# Altium project GIGA R1 WiFi.PrjPcb (part 1 of 2)
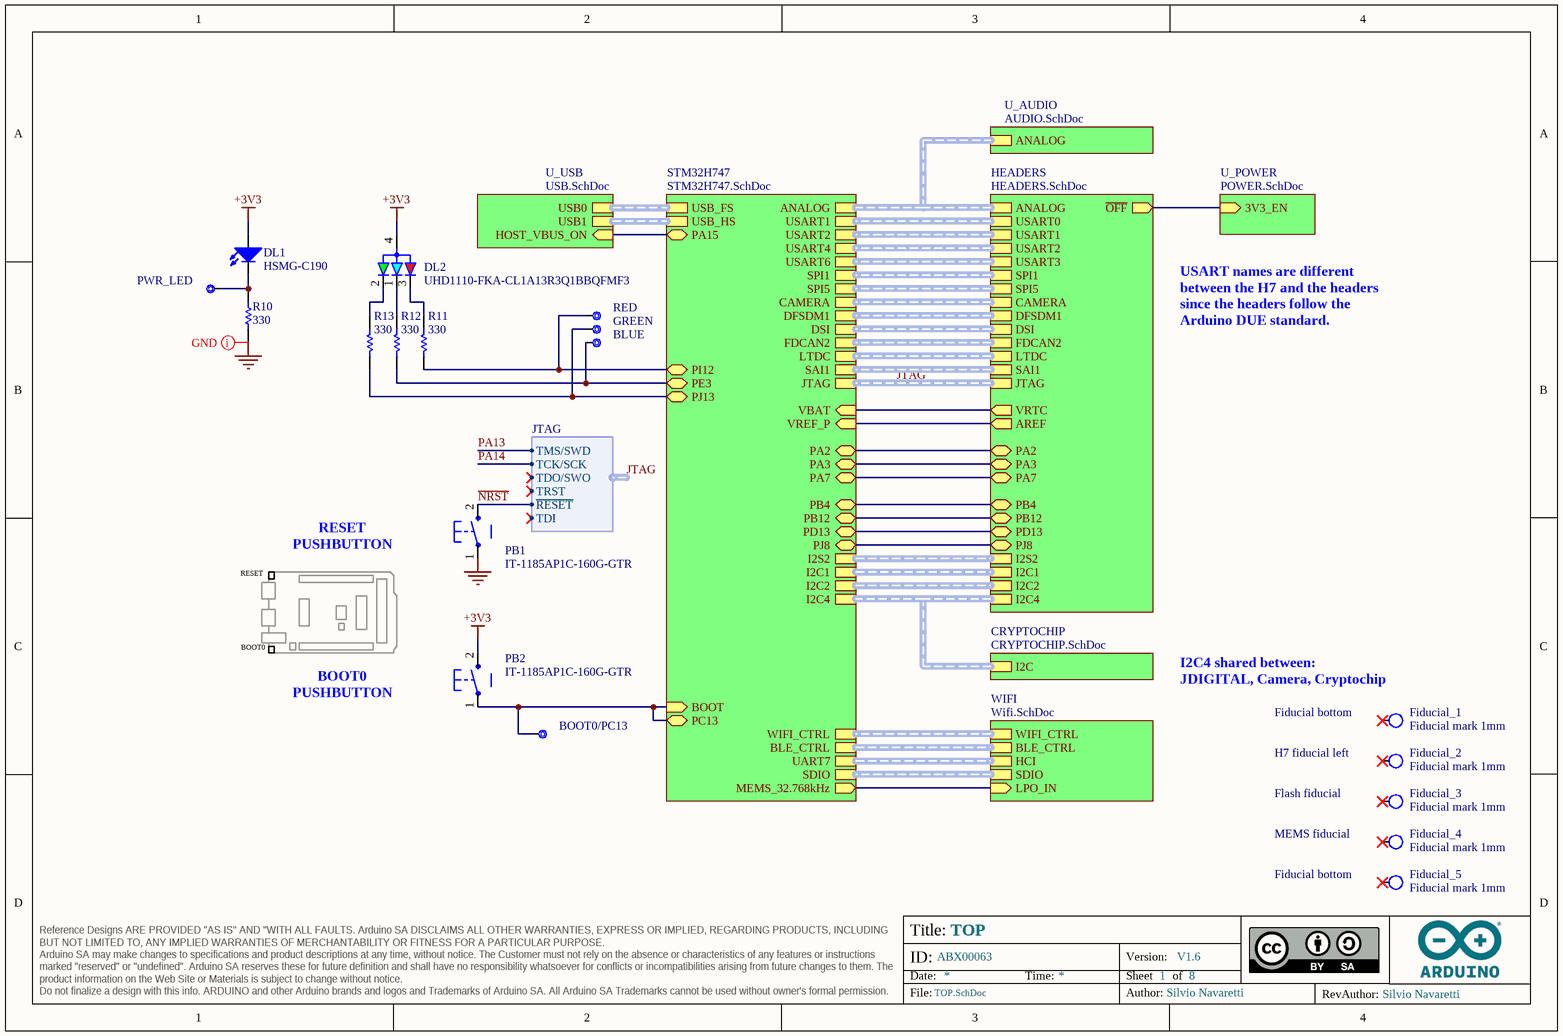
[diagram p0: TOP.SchDoc]
ADJUSTMENTS: _; BGA: X; BOARD_CODENAME: GIGA R1 WiFi; BOARD_INFO_AUTHOR: Silvio Navaretti; BOARD_INFO_AUTHOR_REV: Silvio Navaretti; DRILLS_BLIND: _; DRILLS_BURIED: _; DRILLS_COPPER_FILLING: _; DRILLS_FULL: X; DRILLS_LASER: _; DRILLS_PRESSFIT: _; DRILLS_RESIN_FILLING: _; DRILLS_SLOT: _; DRILLS_SOLDER_FILLING: X; EDGE_PLATING: _; ENIG: X; Er: _; FINISH_TBD: _; FLEX: _; FR4: X; FR4_HTG: _; HAL: _; HAL_LF: _; HOLE_TOP_BOTTOM: X; IPC1: _; IPC2: _; IPC3: _; IPCNA: _; MILLING: X; MIN_INSULATION_INNER: 0.127mm; MIN_INSULATION_OUTER: 0.127mm; MIN_TRACK_WIDTH_INNER: 0.127mm; MIN_TRACK_WIDTH_OUTER: 0.127mm; N_FIGURES: 6; NI/AU: _; NLAYERS: 6; PANEL_NO: _; PANEL_PROVIDED: X; PANEL_REQUESTED: _; PANEL_SIZE: 228mm x 179mm; PCB_SIZE: 101.6mm x 53.34mm; POLYMIDE: _; PRESSFIT: _; RIGID: X; RIGID/FLEX: _; SCORING: _; SILK_BOTTOM: X; SILK_COLOR: WHITE; SILK_TOP: X; SKU: ABX00063; SMD: X; SN/PB: _; SOLDERMASK_BOTTOM: X; SOLDERMASK_COLOR: BLUE; SOLDERMASK_PEELABLE_BOTTOM: _; SOLDERMASK_PEELABLE_COLOR: _; SOLDERMASK_PEELABLE_TOP: _; SOLDERMASK_TOP: X; TABS: _; TBD: _; THD: X; THICKNESS: 1.6mm; Version: V1.6
8 sheets, 228 parts. Net scope: hierarchical (ports join the sheet entries above them; power ports are global).
Board files: PCB.PcbDoc, PANEL.PcbDoc
Sheets:
  TOP.SchDoc
    U_AUDIO = AUDIO.SchDoc
    U_POWER = POWER.SchDoc
    U_USB = USB.SchDoc
    STM32H747 = STM32H747.SchDoc
    HEADERS = HEADERS.SchDoc
    WIFI = Wifi.SchDoc
    CRYPTOCHIP = CRYPTOCHIP.SchDoc

## Sheet TOP.SchDoc: TOP
size A4; Author: Silvio Navaretti; CompanyName: Arduino srl; DocumentNumber: ABX00063; Revision: V1.2; SheetNumber: 1; SheetTotal: 8; RevAuthor: Silvio Navaretti

### Parts
BLUE  CMP-018-0005-A.3  [TP-1.00MM]  (value not drawn)  (no BOM)
BOOT0/PC13  CMP-018-0005-A.3  [TP-1.00MM]  (value not drawn)  (no BOM)
DL1  HSMG-C190  [LEDC1608X80N-AK]
DL2  UHD1110-FKA-CL1A13R3Q1BBQFMF3  [UHD1110-FKA-CL1A13R3Q1BBQFMF3]
Fiducial_1  Fiducial mark 1mm  [Fiducial mark 1mm-Footprint-1]  (no BOM)
Fiducial_2  Fiducial mark 1mm  [Fiducial mark 1mm-Footprint-1]  (no BOM)
Fiducial_3  Fiducial mark 1mm  [Fiducial mark 1mm-Footprint-1]  (no BOM)
Fiducial_4  Fiducial mark 1mm  [Fiducial mark 1mm-Footprint-1]  (no BOM)
Fiducial_5  Fiducial mark 1mm  [Fiducial mark 1mm-Footprint-1]  (no BOM)
GREEN  CMP-018-0005-A.3  [TP-1.00MM]  (value not drawn)  (no BOM)
PB1  IT-1185AP1C-160G-GTR  [C&K_PTS820_NO_HOLES-1]
PB2  IT-1185AP1C-160G-GTR  [C&K_PTS820_NO_HOLES-1]
PWR_LED  CMP-018-0005-A.3  [TP-1.00MM]  (value not drawn)  (no BOM)
R10  value 330  [RES-0402]  (hidden comment: CRCW0402330RJNED)
R11  value 330  [RES-0402]  (hidden comment: CRCW0402330RJNED)
R12  value 330  [RES-0402]  (hidden comment: CRCW0402330RJNED)
R13  value 330  [RES-0402]  (hidden comment: CRCW0402330RJNED)
RED  CMP-018-0005-A.3  [TP-1.00MM]  (value not drawn)  (no BOM)

### Sub-sheets
CRYPTOCHIP = CRYPTOCHIP.SchDoc: I2C (harness I2C)
HEADERS = HEADERS.SchDoc: SPI5 (harness SPI), PB4 (bidir), I2C1 (harness I2C), LTDC (harness LTDC), SAI1 (harness SAI), I2C4 (harness I2C), USART0 (harness UART), USART3 (harness UART), USART2 (harness UART), USART1 (harness UART), I2C2 (harness I2C), PD13 (bidir), PA7 (bidir), PJ8 (bidir), PA2 (bidir), PA3 (bidir), ANALOG (harness ANALOG), FDCAN2 (harness FDCAN), I2S2 (harness I2S), DSI (harness DISPLAY), DFSDM1 (harness DFSDM), SPI1 (harness SPI), CAMERA (harness ARDUCAM), AREF (out), ~{OFF} (out), VRTC (out), JTAG (harness JTAG), PB12 (bidir)
STM32H747 = STM32H747.SchDoc: BOOT (in), DSI (harness DISPLAY), VREF_P (in), SDIO (harness SDC), USB_FS (harness USB), USB_HS (harness USB), PI12 (bidir), PE3 (bidir), PJ13 (bidir), UART7 (harness UART), PC13 (bidir), I2C1 (harness I2C), USART1 (harness UART), USART6 (harness UART), USART4 (harness UART), USART2 (harness UART), I2C2 (harness I2C), ANALOG (harness ANALOG), FDCAN2 (harness FDCAN), LTDC (harness LTDC), SAI1 (harness SAI), I2S2 (harness I2S), DFSDM1 (harness DFSDM), I2C4 (harness I2C), CAMERA (harness ARDUCAM), SPI5 (harness SPI), SPI1 (harness SPI), BLE_CTRL (harness BLE CTRL), WIFI_CTRL (harness WiFi CTRL), PD13 (bidir), PB4 (bidir), PA7 (bidir), PJ8 (bidir), PA2 (bidir), PA3 (bidir), JTAG (harness JTAG), PB12 (bidir), VBAT (in), MEMS_32.768kHz (out), PA15 (bidir)
U_AUDIO = AUDIO.SchDoc: ANALOG (harness ANALOG)
U_POWER = POWER.SchDoc: 3V3_EN (in)
U_USB = USB.SchDoc: USB0 (harness USB), USB1 (harness USB), HOST_VBUS_ON (in)
WIFI = Wifi.SchDoc: BLE_CTRL (harness BLE CTRL), HCI (harness UART), WIFI_CTRL (harness WiFi CTRL), SDIO (harness SDC), LPO_IN (in)

### Harnesses
JTAG: ~{RESET}, TCK/SCK, TDI, TDO/SWO, TMS/SWD, TRST

### Nets
+3V3: DL1.A DL2.4(ANODE) PB2.2
GND: PB1.1 R10.1
MEMS_32.768kHz: sheet STM32H747/MEMS_32.768kHz, sheet WIFI/LPO_IN
~{NRST}: PB1.2 ; sheet STM32H747/JTAG.~{RESET}  [project net JTAG.~{RESET}]
PA2: sheet STM32H747/PA2, sheet HEADERS/PA2
PA3: sheet STM32H747/PA3, sheet HEADERS/PA3
PA7: sheet STM32H747/PA7, sheet HEADERS/PA7
PA15: sheet U_USB/HOST_VBUS_ON, sheet STM32H747/PA15
PB4: sheet STM32H747/PB4, sheet HEADERS/PB4
PB12: sheet STM32H747/PB12, sheet HEADERS/PB12
PC13: BOOT0/PC13.X PB2.1 ; sheet STM32H747/BOOT, sheet STM32H747/PC13
PD13: sheet STM32H747/PD13, sheet HEADERS/PD13
PE3: BLUE.X R12.2 ; sheet STM32H747/PE3
PI12: R11.2 RED.X ; sheet STM32H747/PI12
PJ8: sheet STM32H747/PJ8, sheet HEADERS/PJ8
PJ13: GREEN.X R13.2 ; sheet STM32H747/PJ13
Net3V3_EN_X: sheet U_POWER/3V3_EN, sheet HEADERS/~{OFF}
NetDL1_C: DL1.C PWR_LED.X R10.2
NetDL2_1: DL2.1(BLUE_C) R12.1
NetDL2_2: DL2.2(GREEN_C) R13.1
NetDL2_3: DL2.3(RED_C) R11.1
NetJ1_3: sheet STM32H747/VBAT, sheet HEADERS/VRTC
NetJDIGITAL_3: sheet STM32H747/VREF_P, sheet HEADERS/AREF

Not connected (* = marked no-connect by the designer): Fiducial_1 1*; Fiducial_2 1*; Fiducial_3 1*; Fiducial_4 1*; Fiducial_5 1*

### Buses and harness runs
harness JTAG = sheet HEADERS/JTAG = sheet STM32H747/JTAG
harness sheet CRYPTOCHIP/I2C = sheet HEADERS/I2C4 = sheet STM32H747/I2C4
harness sheet HEADERS/ANALOG = sheet STM32H747/ANALOG = sheet U_AUDIO/ANALOG
harness sheet HEADERS/CAMERA = sheet STM32H747/CAMERA
harness sheet HEADERS/DFSDM1 = sheet STM32H747/DFSDM1
harness sheet HEADERS/DSI = sheet STM32H747/DSI
harness sheet HEADERS/FDCAN2 = sheet STM32H747/FDCAN2
harness sheet HEADERS/I2C1 = sheet STM32H747/I2C1
harness sheet HEADERS/I2C2 = sheet STM32H747/I2C2
harness sheet HEADERS/I2S2 = sheet STM32H747/I2S2
harness sheet HEADERS/LTDC = sheet STM32H747/LTDC
harness sheet HEADERS/SAI1 = sheet STM32H747/SAI1
harness sheet HEADERS/SPI1 = sheet STM32H747/SPI1
harness sheet HEADERS/SPI5 = sheet STM32H747/SPI5
harness sheet HEADERS/USART0 = sheet STM32H747/USART1
harness sheet HEADERS/USART1 = sheet STM32H747/USART2
harness sheet HEADERS/USART2 = sheet STM32H747/USART4
harness sheet HEADERS/USART3 = sheet STM32H747/USART6
harness sheet STM32H747/BLE_CTRL = sheet WIFI/BLE_CTRL
harness sheet STM32H747/SDIO = sheet WIFI/SDIO
harness sheet STM32H747/UART7 = sheet WIFI/HCI
harness sheet STM32H747/USB_FS = sheet U_USB/USB0
harness sheet STM32H747/USB_HS = sheet U_USB/USB1
harness sheet STM32H747/WIFI_CTRL = sheet WIFI/WIFI_CTRL

### Layout directives
net class GND: GND

### Notes on the sheet
- USART names are different between the H7 and the headers since the headers follow the Arduino DUE standard.
- RESET
- RESET
  PUSHBUTTON
- BOOT0
- BOOT0
  PUSHBUTTON
- (near Fiducial_1) I2C4 shared between:
  JDIGITAL, Camera, Cryptochip
- (near Fiducial_1) Fiducial bottom
- (near Fiducial_2) H7 fiducial left
- Flash fiducial
- MEMS fiducial
- Fiducial bottom
- Title:
- ID:
- Date:
- Time:
- Version:
- Sheet
- of
- RevAuthor:
- Reference Designs ARE PROVIDED "AS IS" AND "WITH ALL FAULTS. Arduino SA DISCLAIMS ALL OTHER WARRANTIES, EXPRESS OR IMPLIED, REGARDING PRODUCTS, INCLUDING BUT NOT LIMITED TO, ANY IMPLIED WARRANTIES OF MERCHANTABILITY OR FITNESS FOR A PARTICULAR PURPOSE.
  Arduino SA may make changes to specifications and product descriptions at any time, without notice. The Customer must not rely on the absence or characteristics of any features or instructions marked "reserved" or "undefined". Arduino SA reserves these for future definition and shall have no responsibility whatsoever for conflicts or incompatibilities arising from future changes to them. The product information on the Web Site or Materials is subject to change without notice.
  Do not finalize a design with this info. ARDUINO and other Arduino brands and logos and Trademarks of Arduino SA. All Arduino SA Trademarks cannot be used without owner's formal permission.
- File:
- Author:

### Library data of the parts
BLUE BOOT0/PC13 GREEN PWR_LED RED = UT0013-A.4: Test point 1.00mm; Design Item ID: CMP-018-0005-A.3; Source: ut.SchLib; Pin Count: 1
DL1 = L0009-A.5: LED SMD 0603 GREEN/568 15mcd 120^; Manufacturer: Broadcom; Code Arduino: 2204; Part Number: HSMG-C190; Pin Count: 2
DL2 = L0026-A.4: LED RGB BLACK BODY SMD; Manufacturer: Cree LED; Code Arduino: L0026; Part Number: UHD1110-FKA-CL1A13R3Q1BBQFMF3; Pin Count: 4
Fiducial_1-Fiducial_5 = UT0023-A.6: Fiducial mark 1mm clearance 2mm
PB1 PB2 = B0001-A.7: PUSHBUTTON WHITE NO ANCHORS; Manufacturer: Switronic; Code Arduino: 0173; Part Number: IT-1185AP1C-160G-GTR; Mount: SMT; Color: White
R10-R13 = R0017-A.23: RES CHIP 0402 330R 5% 1/16W; Manufacturer: Vishay; Power: 62.5mW; Code Arduino: 2229; Temperature coefficient: 200ppm; Tolerance: 5%; Part Number: CRCW0402330RJNED; Case Code (Imperial): 0402; Technology: Thick film

## Sheet AUDIO.SchDoc: AUDIO
size A4; Author: Silvio Navaretti; CompanyName: Arduino srl; DocumentNumber: ABX00063; Revision: V1.4; SheetNumber: 7; SheetTotal: 8; RevAuthor: Silvio Navaretti
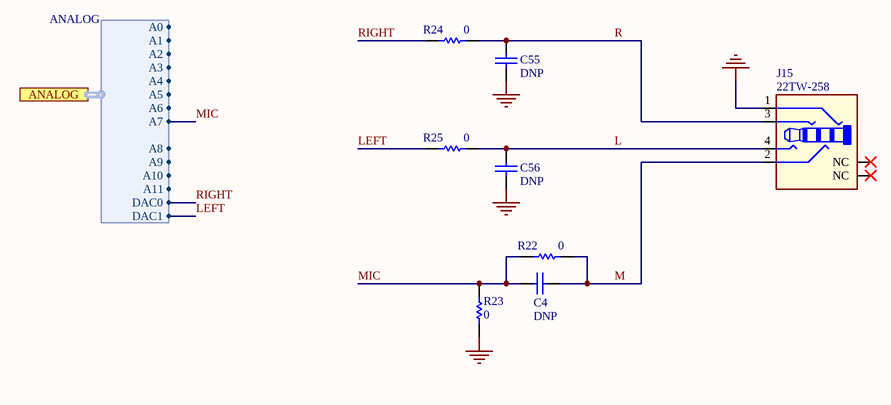
[diagram p1: AUDIO.SchDoc]

### Parts
C4  DNP CAP 0402  [CAP-0402]  (value not drawn)
C55  DNP CAP 0402  [CAP-0402]  (value not drawn)
C56  DNP CAP 0402  [CAP-0402]  (value not drawn)
J15  22TW-258  [22TW-258-Footprint-1]
R22  value 0  [RES-0402]  (hidden comment: CRCW04020000Z0EDC)
R23  value 0  [RES-0402]  (hidden comment: CRCW04020000Z0EDC)
R24  value 0  [RES-0402]  (hidden comment: CRCW04020000Z0EDC)
R25  value 0  [RES-0402]  (hidden comment: CRCW04020000Z0EDC)

### Ports
ANALOG (harness ANALOG)

### Harnesses
ANALOG: A0, A1, A2, A3, A7, A6, A5, A4, A8, A9, A10, A11, DAC0, DAC1

### Nets
GND: C55.1 C56.1 J15.1 R23.1
L: C56.2 J15.4 R25.2  [project net L_7]
LEFT: R25.1 ; port ANALOG.DAC1
M: C4.1 J15.2 R22.2  [project net M_7]
MIC: C4.2 R22.1 R23.2 ; port ANALOG.A7
R: C55.2 J15.3 R24.2  [project net R_7]
RIGHT: R24.1 ; port ANALOG.DAC0  [project net PA4]

Not connected (* = marked no-connect by the designer): J15 NC1(NC)* NC2(NC)*

### Notes on the sheet
- Title:
- ID:
- Date:
- Time:
- Version:
- Sheet
- of
- RevAuthor:
- Reference Designs ARE PROVIDED "AS IS" AND "WITH ALL FAULTS. Arduino SA DISCLAIMS ALL OTHER WARRANTIES, EXPRESS OR IMPLIED, REGARDING PRODUCTS, INCLUDING BUT NOT LIMITED TO, ANY IMPLIED WARRANTIES OF MERCHANTABILITY OR FITNESS FOR A PARTICULAR PURPOSE.
  Arduino SA may make changes to specifications and product descriptions at any time, without notice. The Customer must not rely on the absence or characteristics of any features or instructions marked "reserved" or "undefined". Arduino SA reserves these for future definition and shall have no responsibility whatsoever for conflicts or incompatibilities arising from future changes to them. The product information on the Web Site or Materials is subject to change without notice.
  Do not finalize a design with this info. ARDUINO and other Arduino brands and logos and Trademarks of Arduino SA. All Arduino SA Trademarks cannot be used without owner's formal permission.
- File:
- Author:

### Library data of the parts
C4 C55 C56 = C0095-A.6: Code Arduino: C0095; Part Number: DNP; Case Code (Imperial): 0402; Technology: Ceramic
J15 = J0273-A.8: Conn Jack 4 POLES 3.5mm SMD; Manufacturer: 4UCONN; Code Arduino: J0273; Part Number: 22TW-258
R22-R25 = R0000-A.23: RES CHIP 0402 0R 1/16W; Manufacturer: Vishay; Power: 62.5mW; Tolerance: 0%; Code Arduino: 0039; Temperature coefficient: 0ppm; Part Number: CRCW04020000Z0EDC; Case Code (Imperial): 0402; Technology: Thick film

## Sheet POWER.SchDoc: POWER
size A4; Author: Silvio Navaretti; CompanyName: Arduino srl; DocumentNumber: ABX00063; Revision: V1.4; SheetNumber: 4; SheetTotal: 8; RevAuthor: Silvio Navaretti
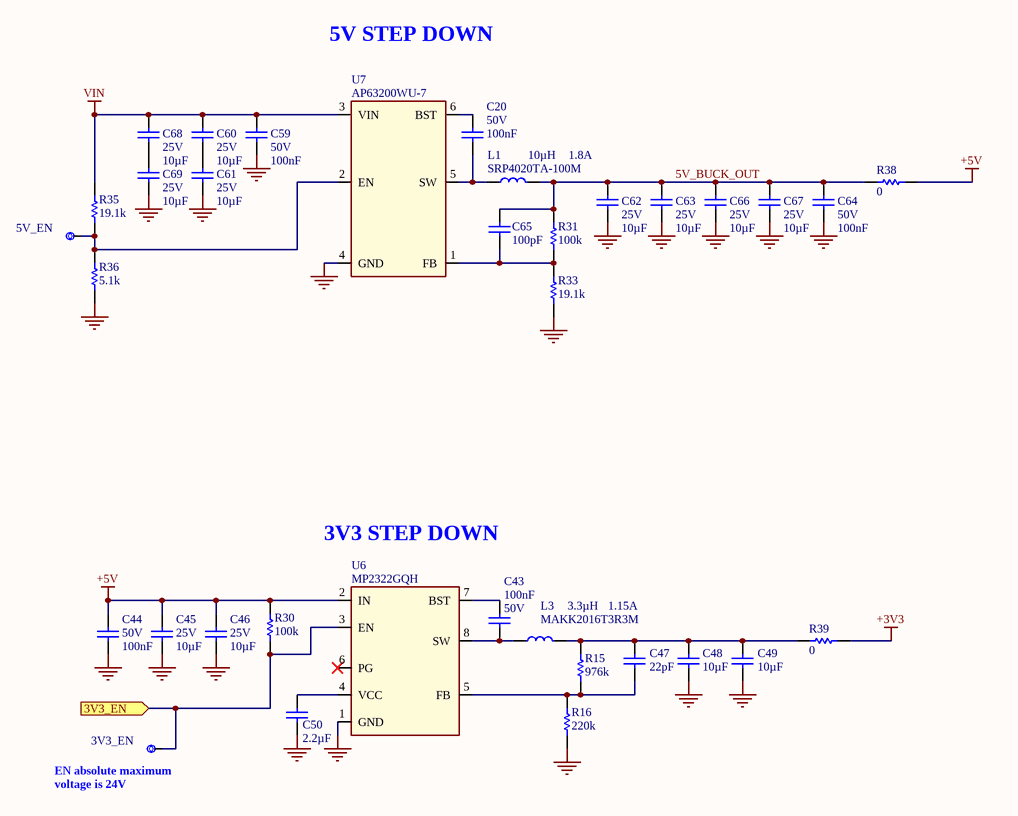
[diagram p2: POWER.SchDoc]

### Parts
3V3_EN  CMP-018-0005-A.3  [TP-1.00MM]  (value not drawn)  (no BOM)
5V_EN  CMP-018-0005-A.3  [TP-1.00MM]  (value not drawn)  (no BOM)
C20  value 100nF  Voltage: 50V  [CAP-0402]  (hidden comment: GRM155R61H104KE19D)
C43  value 100nF  Voltage: 50V  [CAP-0402]  (hidden comment: GRM155R61H104KE19D)
C44  value 100nF  Voltage: 50V  [CAP-0402]  (hidden comment: GRM155R61H104KE19D)
C45  value 10µF  Voltage: 25V  [CAP-0603]  (hidden comment: C1608A106M250NT)
C46  value 10µF  Voltage: 25V  [CAP-0603]  (hidden comment: C1608A106M250NT)
C47  value 22pF  [CAP-0402]  (hidden comment: 0402N220J500CT)
C48  value 10µF  [CAP-0603]  (hidden comment: C1608A106M250NT)
C49  value 10µF  [CAP-0603]  (hidden comment: C1608A106M250NT)
C50  value 2.2µF  [CAP-0402]  (hidden comment: GRM155R60J225KE95D)
C59  value 100nF  Voltage: 50V  [CAP-0402]  (hidden comment: GRM155R61H104KE19D)
C60  value 10µF  Voltage: 25V  [CAP-0603]  (hidden comment: C1608A106M250NT)
C61  value 10µF  Voltage: 25V  [CAP-0603]  (hidden comment: C1608A106M250NT)
C62  value 10µF  Voltage: 25V  [CAP-0603]  (hidden comment: C1608A106M250NT)
C63  value 10µF  Voltage: 25V  [CAP-0603]  (hidden comment: C1608A106M250NT)
C64  value 100nF  Voltage: 50V  [CAP-0402]  (hidden comment: GRM155R61H104KE19D)
C65  value 100pF  [CAP-0402]  (hidden comment: CC0402JRNPO9BN101)
C66  value 10µF  Voltage: 25V  [CAP-0603]  (hidden comment: C1608A106M250NT)
C67  value 10µF  Voltage: 25V  [CAP-0603]  (hidden comment: C1608A106M250NT)
C68  value 10µF  Voltage: 25V  [CAP-0603]  (hidden comment: C1608A106M250NT)
C69  value 10µF  Voltage: 25V  [CAP-0603]  (hidden comment: C1608A106M250NT)
L1  SRP4020TA-100M  Inductance: 10µH  Current: 1.8A  [SRP4020]
L3  MAKK2016T3R3M  Max DC Current: 1.15A  Inductance: 3.3µH  [MAKK2016T3R3M-Footprint-1]
R15  value 976k  [RES-0402]  (hidden comment: CRCW0402976KFKED)
R16  value 220k  [RES-0402]  (hidden comment: CRCW0402220KFKED)
R30  value 100k  [RES-0402]  (hidden comment: CRCW0402100KFKEDC)
R31  value 100k  [RES-0402]  (hidden comment: CRCW0402100KFKEDC)
R33  value 19.1k  [RES-0402]  (hidden comment: CRCW040219K1FKEDC)
R35  value 19.1k  [RES-0402]  (hidden comment: CRCW040219K1FKEDC)
R36  value 5.1k  [RES-0402]  (hidden comment: RC0402FR-075K1L)
R38  value 0  [RES-0402]  (hidden comment: CRCW04020000Z0EDC)
R39  value 0  [RES-0402]  (hidden comment: CRCW04020000Z0EDC)
U6  MP2322GQH  [QFN50P150X200X90-8L]
U7  AP63200WU-7  [SOT95P280X100-6N]

### Ports
3V3_EN (in)

### Nets
+3V3: R39.2
+5V: C44.1 C45.2 C46.2 R30.1 R38.2 U6.2(IN)
GND: C44.2 C45.1 C46.1 C48.1 C49.1 C50.1 C59.2 C61.1 C62.1 C63.1 C64.2 C66.1 C67.1 C69.1 R16.1 R33.1 R36.2 U6.1(GND) U7.4(GND)
VIN: C59.1 C60.2 C68.2 R35.1 U7.3(VIN)
5V_BUCK_OUT: C62.2 C63.2 C64.1 C65.2 C66.2 C67.2 L1.2 R31.1 R38.1  [project net 5V_BUCK_OUT_4]
Net3V3_EN_X: 3V3_EN.X R30.2 U6.3(EN) ; port 3V3_EN
Net5V_EN_X: 5V_EN.X R35.2 R36.1 U7.2(EN)
NetC20_1: C20.1 U7.6(BST)
NetC20_2: C20.2 L1.1 U7.5(SW)
NetC43_1: C43.1 L3.1 U6.8(SW)
NetC43_2: C43.2 U6.7(BST)
NetC47_1: C47.1 R15.1 R16.2 U6.5(FB)
NetC47_2: C47.2 C48.2 C49.2 L3.2 R15.2 R39.1
NetC50_2: C50.2 U6.4(VCC)
NetC60_1: C60.1 C61.2
NetC65_1: C65.1 R31.2 R33.2 U7.1(FB)
NetC68_1: C68.1 C69.2

Not connected (* = marked no-connect by the designer): U6 6(PG)*

### Notes on the sheet
- 5V STEP DOWN
- 3V3 STEP DOWN
- (near 3V3_EN) EN absolute maximum voltage is 24V
- Title:
- ID:
- Date:
- Time:
- Version:
- Sheet
- of
- RevAuthor:
- Reference Designs ARE PROVIDED "AS IS" AND "WITH ALL FAULTS. Arduino SA DISCLAIMS ALL OTHER WARRANTIES, EXPRESS OR IMPLIED, REGARDING PRODUCTS, INCLUDING BUT NOT LIMITED TO, ANY IMPLIED WARRANTIES OF MERCHANTABILITY OR FITNESS FOR A PARTICULAR PURPOSE.
  Arduino SA may make changes to specifications and product descriptions at any time, without notice. The Customer must not rely on the absence or characteristics of any features or instructions marked "reserved" or "undefined". Arduino SA reserves these for future definition and shall have no responsibility whatsoever for conflicts or incompatibilities arising from future changes to them. The product information on the Web Site or Materials is subject to change without notice.
  Do not finalize a design with this info. ARDUINO and other Arduino brands and logos and Trademarks of Arduino SA. All Arduino SA Trademarks cannot be used without owner's formal permission.
- File:
- Author:

### Library data of the parts
3V3_EN 5V_EN = UT0013-A.4: Test point 1.00mm; Design Item ID: CMP-018-0005-A.3; Source: ut.SchLib; Pin Count: 1
C20 C43 C44 C59 C64 = C0015-A.14: CAP CHIP 0402 100nF 10% 50V X5R; Manufacturer: Murata; Code Arduino: A5141; Part Number: GRM155R61H104KE19D; Tolerance: 10%; Dielectric: X5R; Case Code (Imperial): 0402; Technology: Ceramic
C45 C46 C48 C49 C60-C63 C66-C69 = C0047-A.18: CAP CHIP 0603 10uF 20% 25V X5R; Manufacturer: Hottech; Code Arduino: 2213; Manufacturer 2: Murata Electronics; Part Number: C1608A106M250NT; Dielectric: X5R; Tolerance: 20%; Case Code (Imperial): 0603; Part number 2: CL10A106MA8NRNC; Technology: Ceramic
  C48 C49: Voltage: 25V
C47 = C0029-A.14: CAP CHIP 0402 22pF 5% 50V C0G; Manufacturer: Walsin; Code Arduino: 0137; Case Code (Imperial): 0402; Tolerance: 5%; Part Number: 0402N220J500CT; Manufacturer 2: Murata Electronics; Voltage: 50V; Dielectric: C0G; Part number 3: C0402C220K5GAC7867; Part number 2: GRM1555C1H220JA01D; Manufacturer 3: KEMET; Technology: Ceramic
C50 = C0031-A.14: CAP CHIP 0402 2.2uF 10% 6.3V X5R; Manufacturer: Murata; Code Arduino: A5529; Tolerance: 10%; Voltage: 6.3V; Part Number: GRM155R60J225KE95D; Dielectric: X5R; Case Code (Imperial): 0402; Technology: Ceramic
C65 = C0013-A.4: CAP CHIP 0402 100pF 10% 50V C0G; Manufacturer: Yageo; Code Arduino: C0013; Tolerance: 5%; Case Code (Imperial): 0402; Dielectric: C0G; Voltage: 50V; Part Number: CC0402JRNPO9BN101; Technology: Ceramic
L1 = I0065-A.2: IND FIXED 10UH IRMS 1.8A ISAT 2.3A 243m ohm SMD 4.45x4mm; Manufacturer: Bourns; Value: 10u; Code Arduino: I0065; Part Number: SRP4020TA-100M; Device Type: Inductor
L3 = I0045-A.10: IND CHIP 0806 3.3 uH 20% 1.2A; Manufacturer: Taiyo Yuden; Core Material: Metal; DC Resistance (DCR): 255mR; Code Arduino: I0045; Test Frequency: 2MHz; Shielding: Shielded; Value: 3.3µH; Max Operating Temperature: 105°C; Height - Seated (Max): 0.039inch; Halogen Free: Halogen Free; Device Type: Inductor; Min Operating Temperature: -40°C; Length: 0.079inch; Packaging: Tape and Reel; Termination: SMD/SMT; Mount: Surface Mount; Height: 1mm; Manufacturer 2: Murata; Saturation Current: 1.15A; Part Number: MAKK2016T3R3M; Package Quantity: 3000; Case Code (Imperial): 0806; Manufacturer Part Number 2: LQM2MPN3R3NG0L; Width: 1.6mm; Tolerance: 20%; Resistor Type: Wirewound; Case Code (Metric): 2016; Case/Package: 0806; Current Rating: 1.2A
R15 = R0070-A.24: RES CHIP 0402 976k 1% 1/16W; Manufacturer: Vishay; Power: 62.5mW; Code Arduino: R0070; Temperature coefficient: 100ppm; Tolerance: 1%; Part Number: CRCW0402976KFKED; Case Code (Imperial): 0402; Technology: Thick film
R16 = R0028-A.23: RES CHIP 0402 220k 1% 1/16W; Manufacturer: Vishay; Code Arduino: 2334; Power: 62.5mW; Temperature coefficient: 200ppm; Part Number: CRCW0402220KFKED; Case Code (Imperial): 0402; Tolerance: 1%; Technology: Thick film
R30 R31 = R0001-A.23: RES CHIP 0402 100k 1% 1/16W; Manufacturer: Vishay; Power: 62.5mW; Code Arduino: 0134; Temperature coefficient: 100ppm; Part Number: CRCW0402100KFKEDC; Tolerance: 1%; Case Code (Imperial): 0402; Technology: Thick film
R33 = R0033-A.23: RES CHIP 0402 19k1 1% 1/16W; Manufacturer: Vishay; Code Arduino: A5369; Power: 62.5mW; Temperature coefficient: 100ppm; Tolerance: 1%; Part Number: CRCW040219K1FKEDC; Case Code (Imperial): 0402; Technology: Thick film
R35 = R0033-A.23: RES CHIP 0402 19k1 1% 1/16W; Manufacturer: Vishay; Power: 62.5mW; Code Arduino: A5369; Temperature coefficient: 100ppm; Part Number: CRCW040219K1FKEDC; Tolerance: 1%; Case Code (Imperial): 0402; Technology: Thick film
R36 = R0210-A.18: RES CHIP 0402 5k1 1% 1/16W; Manufacturer: YAGEO; Power: 63mW; Code Arduino: R0210; Temperature coefficient: 100ppm; Part Number: RC0402FR-075K1L; Tolerance: 1%; Case Code (Imperial): 0402; Technology: Thick film
R38 R39 = R0000-A.23: as R22 on sheet AUDIO; Part Number: CRCW04020000Z0EDC; Case Code (Imperial): 0402; Technology: Thick film
U6 = U0072-A.8: IC STEP DOWN CONV 1A 22V QFN8; Manufacturer: Monolithic Power Systems; Code Arduino: U0072; Part Number: MP2322GQH
U7 = U0241-A.6: IC BUCK VIN 3V8 to 32V Iout 4A duty 100% fsw 500kHz TSOT26; Manufacturer: Diodes Incorporated; Code Arduino: U0241; Part Number: AP63200WU-7

## Sheet USB.SchDoc: USB
size A4; Author: Silvio Navaretti; CompanyName: Arduino srl; DocumentNumber: ABX00063; Revision: V1.4; SheetNumber: 3; SheetTotal: 8; RevAuthor: Silvio Navaretti
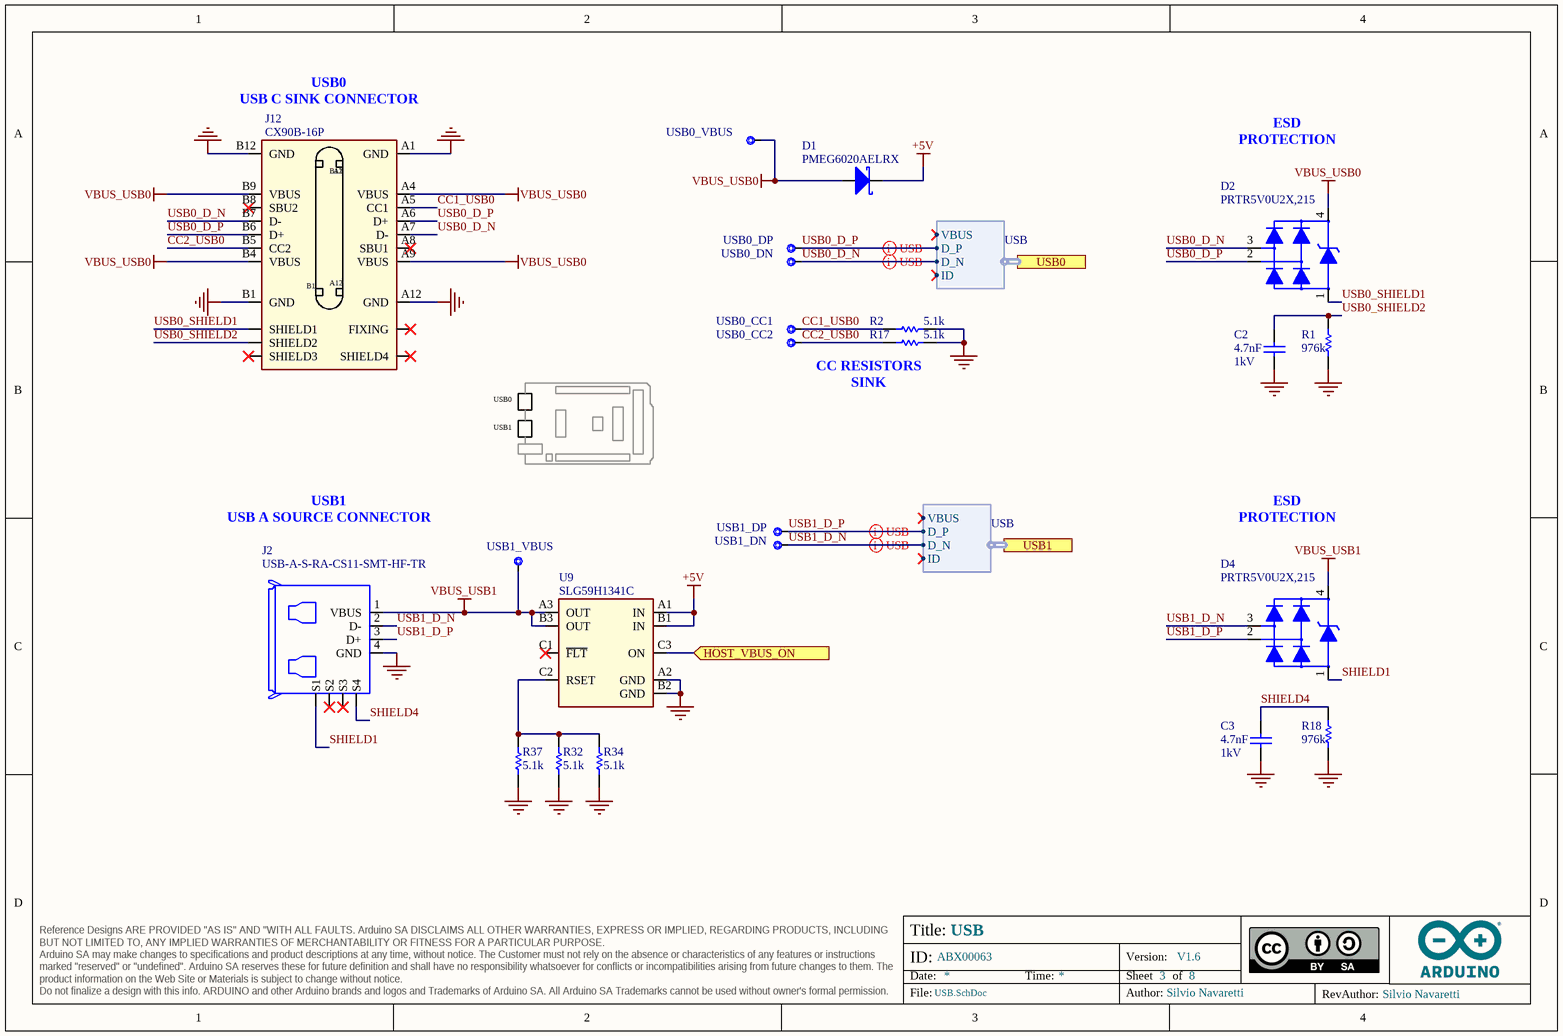
[diagram p3: USB.SchDoc]

### Parts
C2  value 4.7nF  Voltage: 1kV  [CAP-0805]  (hidden comment: FV21X472K102ECG)
C3  value 4.7nF  Voltage: 1kV  [CAP-0805]  (hidden comment: FV21X472K102ECG)
D1  PMEG6020AELRX  [SOD123-1]
D2  PRTR5V0U2X,215  [SOT190P230X110-4N]
D4  PRTR5V0U2X,215  [SOT190P230X110-4N]
J2  USB-A-S-RA-CS11-SMT-HF-TR  [USB-A-S-RA-CS11-SMT-HF-TR]
J12  CX90B-16P  [CX90B-16P-Footprint-1]
R1  value 976k  [RES-0402]  (hidden comment: CRCW0402976KFKED)
R2  value 5.1k  [RES-0402]  (hidden comment: RC0402FR-075K1L)
R17  value 5.1k  [RES-0402]  (hidden comment: RC0402FR-075K1L)
R18  value 976k  [RES-0402]  (hidden comment: CRCW0402976KFKED)
R32  value 5.1k  [RES-0402]  (hidden comment: RC0402FR-075K1L)
R34  value 5.1k  [RES-0402]  (hidden comment: RC0402FR-075K1L)
R37  value 5.1k  [RES-0402]  (hidden comment: RC0402FR-075K1L)
U9  SLG59H1341C  [BGA9C40P3X3_121X121X62]
USB0_CC1  CMP-018-0005-A.3  [TP-1.00MM]  (value not drawn)  (no BOM)
USB0_CC2  CMP-018-0005-A.3  [TP-1.00MM]  (value not drawn)  (no BOM)
USB0_DN  CMP-018-0005-A.3  [TP-1.00MM]  (value not drawn)  (no BOM)
USB0_DP  CMP-018-0005-A.3  [TP-1.00MM]  (value not drawn)  (no BOM)
USB0_VBUS  CMP-018-0005-A.3  [TP-1.00MM]  (value not drawn)  (no BOM)
USB1_DN  CMP-018-0005-A.3  [TP-1.00MM]  (value not drawn)  (no BOM)
USB1_DP  CMP-018-0005-A.3  [TP-1.00MM]  (value not drawn)  (no BOM)
USB1_VBUS  CMP-018-0005-A.3  [TP-1.00MM]  (value not drawn)  (no BOM)

### Ports
HOST_VBUS_ON (in), USB0 (harness USB), USB1 (harness USB)

### Harnesses
USB: VBUS, D_P, D_N, ID

### Nets
+5V: D1.C U9.A1(IN) U9.B1(IN)
GND: C2.1 C3.1 J2.4(GND) J12.A1(GND) J12.A12(GND) J12.B1(GND) J12.B12(GND) R1.1 R2.2 R17.2 R18.1 R32.1 R34.1 R37.1 U9.A2(GND) U9.B2(GND)
VBUS_USB0: D1.A D2.4 J12.A4(VBUS) J12.A9(VBUS) J12.B4(VBUS) J12.B9(VBUS) USB0_VBUS.X
VBUS_USB1: D4.4 J2.1(VBUS) U9.A3(OUT) U9.B3(OUT) USB1_VBUS.X
CC1_USB0: J12.A5(CC1) R2.1 USB0_CC1.X  [project net CC1_USB0_3]
CC2_USB0: J12.B5(CC2) R17.1 USB0_CC2.X  [project net CC2_USB0_3]
PA15: U9.C3(ON) ; port HOST_VBUS_ON
SHIELD1: D4.1 J2.SHIELD1(S1)  [project net SHIELD1_3]
SHIELD4: C3.2 J2.SHIELD4(S4) R18.2  [project net SHIELD4_3]
USB0_D_N: D2.3 J12.A7(D-) J12.B7(D-) USB0_DN.X ; port USB0.D_N
USB0_D_P: D2.2 J12.A6(D+) J12.B6(D+) USB0_DP.X ; port USB0.D_P
USB0_SHIELD1: D2.1 J12.SHIELD1  [project net USB0_SHIELD1_3]
USB0_SHIELD2: C2.2 J12.SHIELD2 R1.2  [project net USB0_SHIELD2_3]
USB1_D_N: D4.3 J2.2(D-) USB1_DN.X ; port USB1.D_N
USB1_D_P: D4.2 J2.3(D+) USB1_DP.X ; port USB1.D_P
NetR32_2: R32.2 R34.2 R37.2 U9.C2(RSET)

Not connected (* = marked no-connect by the designer): J2 SHIELD2(S2)* SHIELD3(S3)*; J12 A8(SBU1)* B8(SBU2)* FIXING* SHIELD3* SHIELD4*; U9 C1(~{FLT})*

### Layout directives
differential pair; differential pair class USB: USB0_D_N, USB0_D_P, USB1_D_N, USB1_D_P

### Notes on the sheet
- (near J12) USB0
  USB C SINK CONNECTOR
- ESD PROTECTION
- USB0
- USB1
- CC RESISTORS
  SINK
- USB1
  USB A SOURCE CONNECTOR
- Title:
- ID:
- Date:
- Time:
- Version:
- Sheet
- of
- RevAuthor:
- Reference Designs ARE PROVIDED "AS IS" AND "WITH ALL FAULTS. Arduino SA DISCLAIMS ALL OTHER WARRANTIES, EXPRESS OR IMPLIED, REGARDING PRODUCTS, INCLUDING BUT NOT LIMITED TO, ANY IMPLIED WARRANTIES OF MERCHANTABILITY OR FITNESS FOR A PARTICULAR PURPOSE.
  Arduino SA may make changes to specifications and product descriptions at any time, without notice. The Customer must not rely on the absence or characteristics of any features or instructions marked "reserved" or "undefined". Arduino SA reserves these for future definition and shall have no responsibility whatsoever for conflicts or incompatibilities arising from future changes to them. The product information on the Web Site or Materials is subject to change without notice.
  Do not finalize a design with this info. ARDUINO and other Arduino brands and logos and Trademarks of Arduino SA. All Arduino SA Trademarks cannot be used without owner's formal permission.
- File:
- Author:

### Library data of the parts
C2 C3 = C0059-A.14: CAP CHIP 0805 4.7nF 10% 1000V X7R; Manufacturer: PSA Shenzen; Code Arduino: 0689; Manufacturer 2: KEMET; Tolerance: 10%; Case Code (Imperial): 0805; Part Number: FV21X472K102ECG; Dielectric: X7R; Part number 2: C0805V472KDRACTU; Part number 3: C0805C472KDRACTU; Manufacturer 3: KEMET; Technology: Ceramic
D1 = D0026-A.6: DIODE SCHOTTKY SMD 2A 60V SOD123FL; Manufacturer: Nexperia; Manucturer Part Number 2: SS26L; Code Arduino: 2208; Forward Voltage: 0.6V; Manucturer 2: Hottech; RoHS Compliance: RoHS3; Part Number: PMEG6020AELRX; Device Type: Diode Schottky; Forward Current: 2A
D2 D4 = D0025-A.5: TVS ARRAY 4LIN.8kV 1pF SOT143B; Manufacturer: Nexperia; Device Type: ESD protection; Code Arduino: 2209; Part Number: PRTR5V0U2X,215
J2 = J0329-A.9: CONN USB A 2.0 FEMALE RIGHT ANGLE SMD + TH TAPE AND REEL; Manufacturer: Adam Tech; Code Arduino: J0329; Part Number: USB-A-S-RA-CS11-SMT-HF-TR
J12 = J0272-A.3: CONN RCPT USB3.1 TYPEC 16POS SMD; Manufacturer: Hirose; Code Arduino: J0272; Part Number: CX90B-16P
R1 R18 = R0070-A.24: as R15 on sheet POWER; Case Code (Imperial): 0402; Tolerance: 1%; Part Number: CRCW0402976KFKED; Technology: Thick film
R2 R17 R32 R34 R37 = R0210-A.18: RES CHIP 0402 5k1 1% 1/16W; Manufacturer: YAGEO; Code Arduino: R0210; Power: 63mW; Temperature coefficient: 100ppm; Part Number: RC0402FR-075K1L; Case Code (Imperial): 0402; Tolerance: 1%; Technology: Thick film
U9 = U0272-A.3: IC Power switch 2.5V to 5.5V 1A reverse blocking, adj current limit, WLCSP9; Manufacturer: Renesas; Code Arduino: U0272; Part Number: SLG59H1341C
USB0_CC1 USB0_CC2 USB0_DN USB0_DP USB0_VBUS USB1_DN USB1_DP USB1_VBUS = UT0013-A.4: Test point 1.00mm; Design Item ID: CMP-018-0005-A.3; Source: ut.SchLib; Pin Count: 1

## Sheet STM32H747.SchDoc: STM32H747
size A3; Author: Silvio Navaretti; CompanyName: Arduino srl; DocumentNumber: ABX00063; Revision: V1.4; SheetNumber: 5; SheetTotal: 8; RevAuthor: Silvio Navaretti
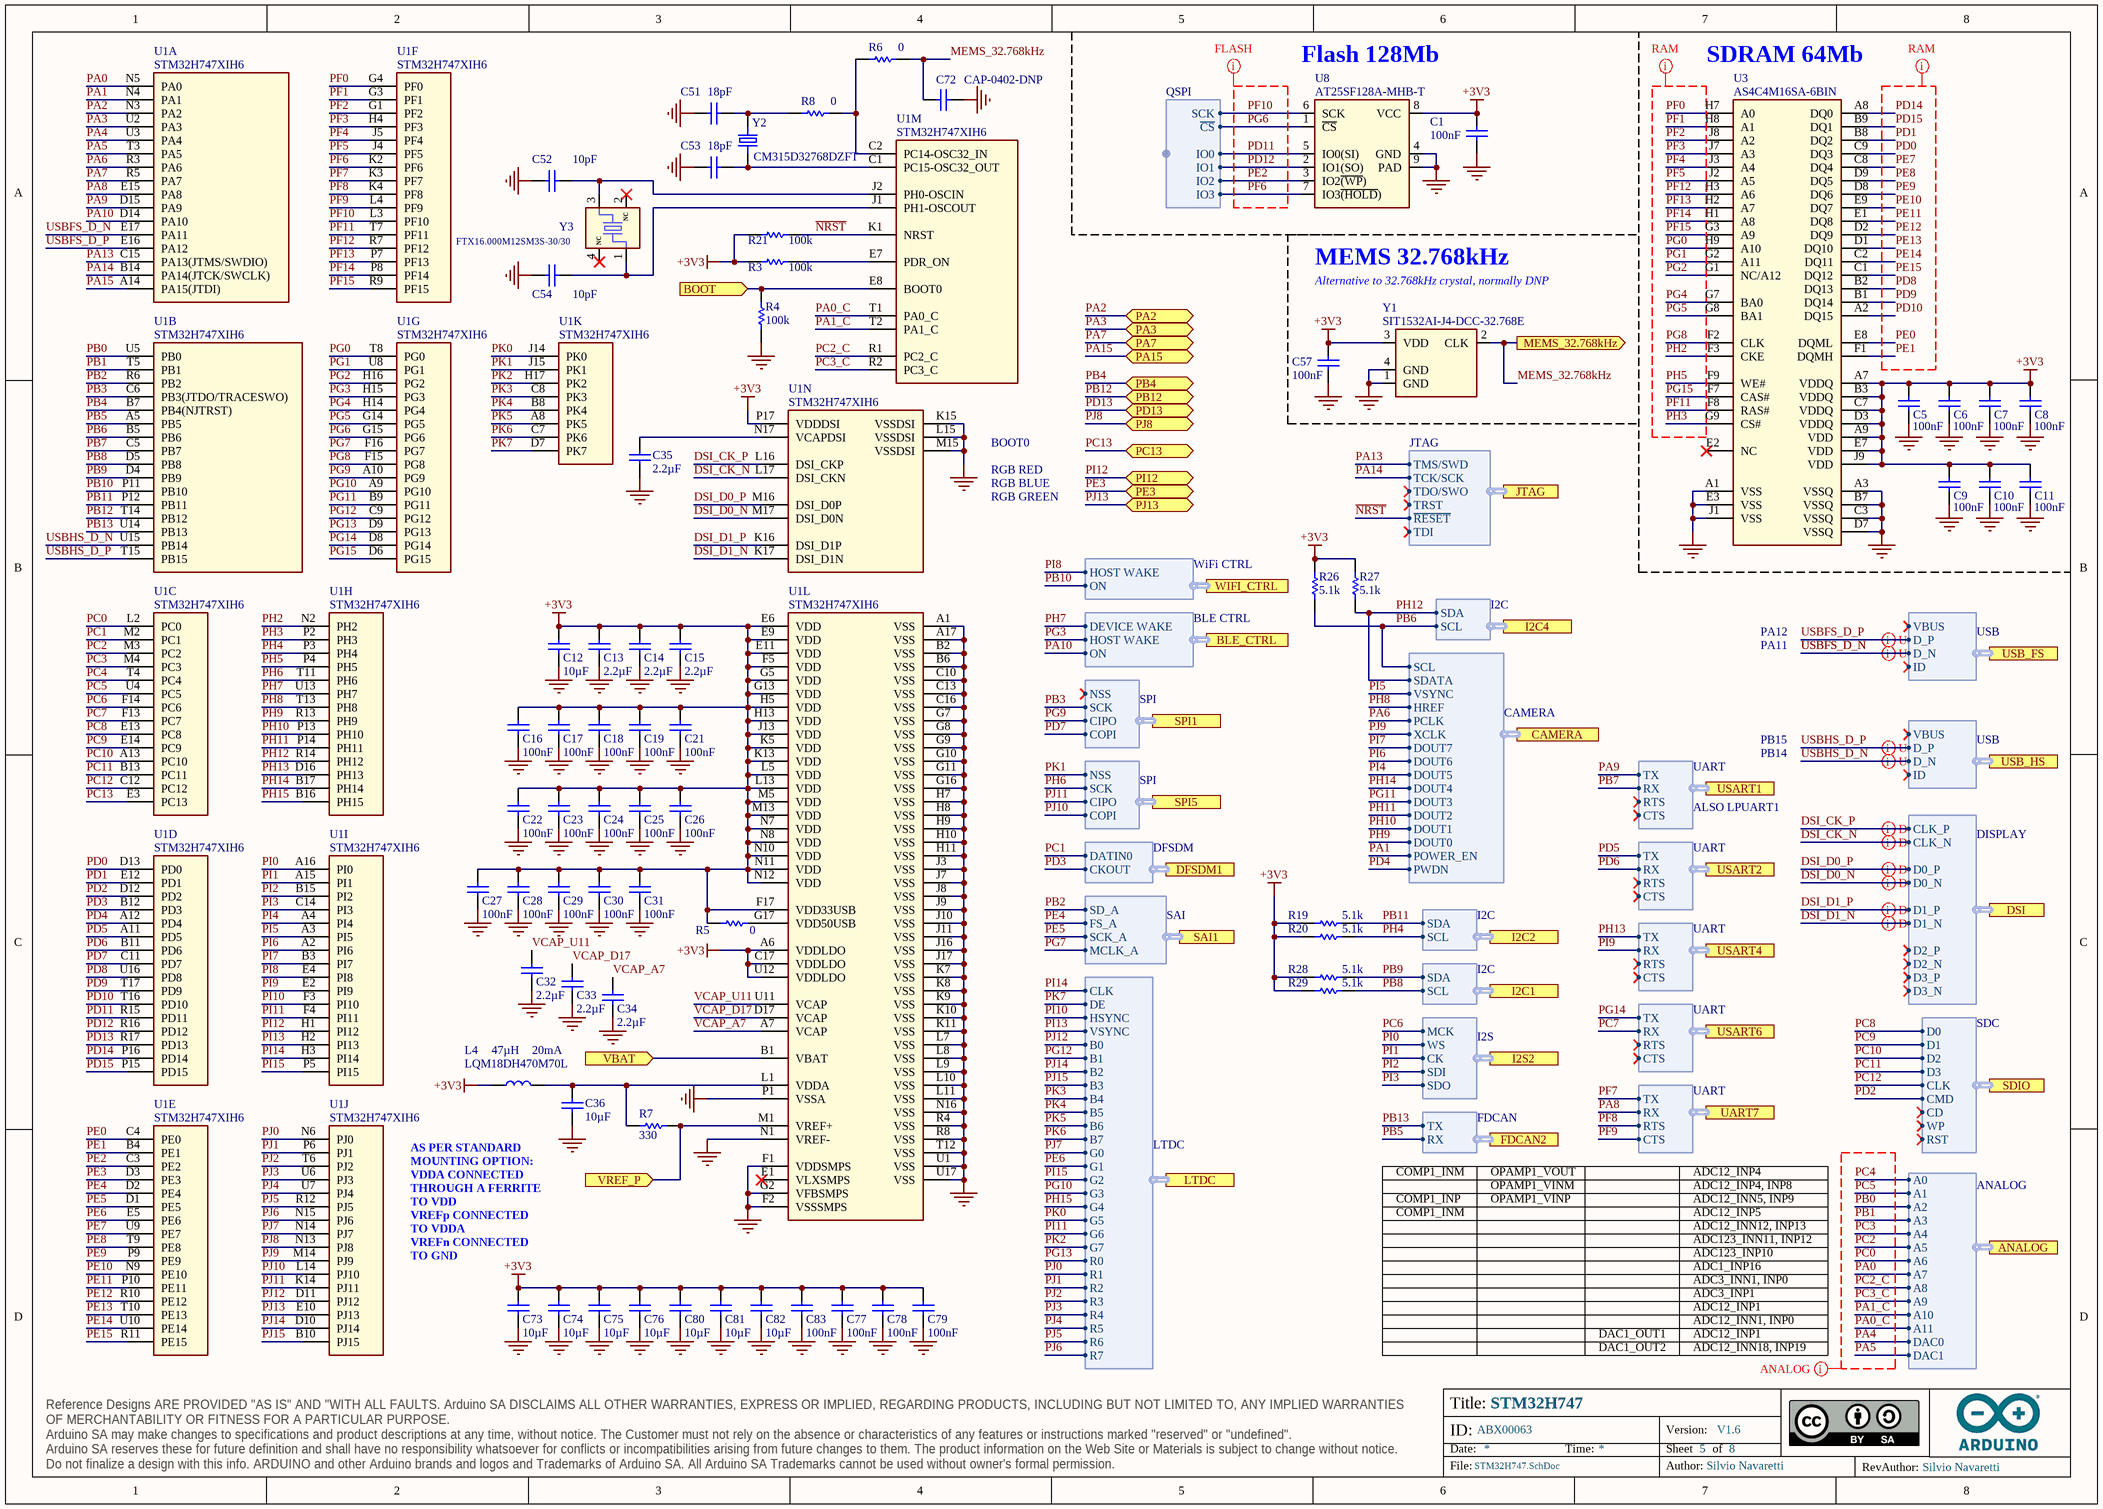
[diagram p4: STM32H747.SchDoc]

### Parts
C1  value 100nF  [CAP-0402]  (hidden comment: GRM155R61H104KE19D)
C5  value 100nF  [CAP-0402]  (hidden comment: GRM155R61H104KE19D)
C6  value 100nF  [CAP-0402]  (hidden comment: GRM155R61H104KE19D)
C7  value 100nF  [CAP-0402]  (hidden comment: GRM155R61H104KE19D)
C8  value 100nF  [CAP-0402]  (hidden comment: GRM155R61H104KE19D)
C9  value 100nF  [CAP-0402]  (hidden comment: GRM155R61H104KE19D)
C10  value 100nF  [CAP-0402]  (hidden comment: GRM155R61H104KE19D)
C11  value 100nF  [CAP-0402]  (hidden comment: GRM155R61H104KE19D)
C12  value 10µF  [CAP-0402]  (hidden comment: GRM155R60J106ME05D)
C13  value 2.2µF  [CAP-0402]  (hidden comment: GRM155R60J225KE95D)
C14  value 2.2µF  [CAP-0402]  (hidden comment: GRM155R60J225KE95D)
C15  value 2.2µF  [CAP-0402]  (hidden comment: GRM155R60J225KE95D)
C16  value 100nF  [CAP-0402]  (hidden comment: GRM155R61H104KE19D)
C17  value 100nF  [CAP-0402]  (hidden comment: GRM155R61H104KE19D)
C18  value 100nF  [CAP-0402]  (hidden comment: GRM155R61H104KE19D)
C19  value 100nF  [CAP-0402]  (hidden comment: GRM155R61H104KE19D)
C21  value 100nF  [CAP-0402]  (hidden comment: GRM155R61H104KE19D)
C22  value 100nF  [CAP-0402]  (hidden comment: GRM155R61H104KE19D)
C23  value 100nF  [CAP-0402]  (hidden comment: GRM155R61H104KE19D)
C24  value 100nF  [CAP-0402]  (hidden comment: GRM155R61H104KE19D)
C25  value 100nF  [CAP-0402]  (hidden comment: GRM155R61H104KE19D)
C26  value 100nF  [CAP-0402]  (hidden comment: GRM155R61H104KE19D)
C27  value 100nF  [CAP-0402]  (hidden comment: GRM155R61H104KE19D)
C28  value 100nF  [CAP-0402]  (hidden comment: GRM155R61H104KE19D)
C29  value 100nF  [CAP-0402]  (hidden comment: GRM155R61H104KE19D)
C30  value 100nF  [CAP-0402]  (hidden comment: GRM155R61H104KE19D)
C31  value 100nF  [CAP-0402]  (hidden comment: GRM155R61H104KE19D)
C32  value 2.2µF  [CAP-0402]  (hidden comment: GRM155R60J225KE95D)
C33  value 2.2µF  [CAP-0402]  (hidden comment: GRM155R60J225KE95D)
C34  value 2.2µF  [CAP-0402]  (hidden comment: GRM155R60J225KE95D)
C35  value 2.2µF  [CAP-0402]  (hidden comment: GRM155R60J225KE95D)
C36  value 10µF  [CAP-0402]  (hidden comment: GRM155R60J106ME05D)
C51  value 18pF  [CAP-0402]  (hidden comment: C0402C180J5GACTU)
C52  value 10pF  [CAP-0402]  (hidden comment: C0402H100J5GACTU)
C53  value 18pF  [CAP-0402]  (hidden comment: C0402C180J5GACTU)
C54  value 10pF  [CAP-0402]  (hidden comment: C0402H100J5GACTU)
C57  value 100nF  [CAP-0402]  (hidden comment: GRM155R61H104KE19D)
C72  CAP-0402-DNP  [CAP-0402]
C73  value 10µF  [CAP-0402]  (hidden comment: GRM155R60J106ME05D)
C74  value 10µF  [CAP-0402]  (hidden comment: GRM155R60J106ME05D)
C75  value 10µF  [CAP-0402]  (hidden comment: GRM155R60J106ME05D)
C76  value 10µF  [CAP-0402]  (hidden comment: GRM155R60J106ME05D)
C77  value 100nF  [CAP-0402]  (hidden comment: GRM155R61H104KE19D)
C78  value 100nF  [CAP-0402]  (hidden comment: GRM155R61H104KE19D)
C79  value 100nF  [CAP-0402]  (hidden comment: GRM155R61H104KE19D)
C80  value 10µF  [CAP-0402]  (hidden comment: GRM155R60J106ME05D)
C81  value 10µF  [CAP-0402]  (hidden comment: GRM155R60J106ME05D)
C82  value 10µF  [CAP-0402]  (hidden comment: GRM155R60J106ME05D)
C83  value 100nF  [CAP-0402]  (hidden comment: GRM155R61H104KE19D)
L4  LQM18DH470M70L  Current: 20mA  Inductance: 47µH  [L-0603]
R3  value 100k  [RES-0402]  (hidden comment: CRCW0402100KFKEDC)
R4  value 100k  [RES-0402]  (hidden comment: CRCW0402100KFKEDC)
R5  value 0  [RES-0402]  (hidden comment: CRCW04020000Z0EDC)
R6  value 0  [RES-0402]  (hidden comment: CRCW04020000Z0EDC)
R7  value 330  [RES-0402]  (hidden comment: CRCW0402330RJNED)
R8  value 0  [RES-0402]  (hidden comment: CRCW04020000Z0EDC)
R19  value 5.1k  [RES-0402]  (hidden comment: RC0402FR-075K1L)
R20  value 5.1k  [RES-0402]  (hidden comment: RC0402FR-075K1L)
R21  value 100k  [RES-0402]  (hidden comment: CRCW0402100KFKEDC)
R26  value 5.1k  [RES-0402]  (hidden comment: RC0402FR-075K1L)
R27  value 5.1k  [RES-0402]  (hidden comment: RC0402FR-075K1L)
R28  value 5.1k  [RES-0402]  (hidden comment: RC0402FR-075K1L)
R29  value 5.1k  [RES-0402]  (hidden comment: RC0402FR-075K1L)
U1  STM32H747XIH6  [STM32H747XIH6-Footprint-1]  (parts A,B,C,D,E,F,G,H,I,J,K,L,M,N of 14)
U3  AS4C4M16SA-6BIN  [AS4C4M16SA-7BCN-Footprint-1]
U8  AT25SF128A-MHB-T  [PSON127P600X60_HS-9N]
Y1  SIT1532AI-J4-DCC-32.768E  [SiT1532AI-J4-DCC-32.768E-Footprint-1]
Y2  CM315D32768DZFT  [ABS07]
Y3  FTX16.000M12SM3S-30/30  [CRYSTAL_3.2x2.5mm_16MHz]

### Ports
ANALOG (harness ANALOG), BLE_CTRL (harness BLE CTRL), BOOT (in), CAMERA (harness CAMERA), DFSDM1 (harness DFSDM), DSI (harness DISPLAY), FDCAN2 (harness FDCAN), I2C1 (harness I2C), I2C2 (harness I2C), I2C4 (harness I2C), I2S2 (harness I2S), JTAG (harness JTAG), LTDC (harness LTDC), MEMS_32.768kHz (out), PA2 (bidir), PA3 (bidir), PA7 (bidir), PA15 (bidir), PB4 (bidir), PB12 (bidir), PC13 (bidir), PD13 (bidir), PE3 (bidir), PI12 (bidir), PJ8 (bidir), PJ13 (bidir), SAI1 (harness SAI), SDIO (harness SDC), SPI1 (harness SPI), SPI5 (harness SPI), UART7 (harness UART), USART1 (harness UART), USART2 (harness UART), USART4 (harness UART), USART6 (harness UART), USB_FS (harness USB), USB_HS (harness USB), VBAT (in), VREF_P (in), WIFI_CTRL (harness WiFi CTRL)

### Harnesses
DISPLAY: CLK_N, CLK_P, D0_N, D0_P, D1_N, D1_P, D2_N, D2_P, D3_N, D3_P
SDC: CLK, CMD, D0, D1, D2, D3, CD, WP, RST
USB: VBUS, D_P, D_N, ID
UART: RX, TX, RTS, CTS
I2C: SDA, SCL
ANALOG: A0, A1, A2, A3, A7, A6, A5, A4, A8, A9, A10, A11, DAC0, DAC1
FDCAN: RX, TX
LTDC: B0, B1, B2, B3, B4, B5, B6, B7, CLK, DE, G0, G1, G2, G3, G4, G5, G6, G7, HSYNC, R0, R1, R2, R3, R4, R5, R6, R7, VSYNC
SAI: SD_A, FS_A, SCK_A, MCLK_A
I2S: CK, SDI, SDO, WS, MCK
DFSDM: DATIN0, CKOUT
CAMERA: SCL, SDATA, VSYNC, HREF, PCLK, XCLK, DOUT7, DOUT6, DOUT5, DOUT4, DOUT3, DOUT2, DOUT1, DOUT0, POWER_EN, PWDN
SPI: NSS, SCK, CIPO, COPI
BLE CTRL: HOST WAKE, DEVICE WAKE, ON
WiFi CTRL: HOST WAKE, ON
QSPI: SCK, ~{CS}, IO0, IO1, IO2, IO3
JTAG: ~{RESET}, TCK/SCK, TDI, TDO/SWO, TMS/SWD, TRST

### Nets
+3V3: C1.2 C5.2 C6.2 C7.2 C8.2 C9.2 C10.2 C11.2 C12.2 C13.2 C14.2 C15.2 C16.2 C17.2 C18.2 C19.2 C21.2 C22.2 C23.2 C24.2 C25.2 C26.2 C27.2 C28.2 C29.2 C30.2 C31.2 C57.2 C73.2 C74.2 C75.2 C76.2 C77.2 C78.2 C79.2 C80.2 C81.2 C82.2 C83.2 L4.1 R3.1 R5.1 R19.2 R20.2 R21.1 R26.2 R27.2 R28.2 R29.2 U1.A6(VDDLDO) U1.C17(VDDLDO) U1.E6(VDD) U1.E9(VDD) U1.E11(VDD) U1.F5(VDD) U1.F17(VDD33USB) U1.G5(VDD) U1.G13(VDD) U1.H5(VDD) U1.H13(VDD) U1.J13(VDD) U1.K5(VDD) U1.K13(VDD) U1.L5(VDD) U1.L13(VDD) U1.M5(VDD) U1.M13(VDD) U1.N7(VDD) U1.N8(VDD) U1.N10(VDD) U1.N11(VDD) U1.N12(VDD) U1.P17(VDDDSI) U1.U12(VDDLDO) U3.A7(VDDQ) U3.A9(VDD) U3.B3(VDDQ) U3.C7(VDDQ) U3.D3(VDDQ) U3.E7(VDD) U3.J9(VDD) U8.8(VCC) Y1.3(VDD)
GND: C1.1 C5.1 C6.1 C7.1 C8.1 C9.1 C10.1 C11.1 C12.1 C13.1 C14.1 C15.1 C16.1 C17.1 C18.1 C19.1 C21.1 C22.1 C23.1 C24.1 C25.1 C26.1 C27.1 C28.1 C29.1 C30.1 C31.1 C32.1 C33.1 C34.1 C35.1 C36.1 C51.2 C52.2 C53.2 C54.2 C57.1 C72.2 C73.1 C74.1 C75.1 C76.1 C77.1 C78.1 C79.1 C80.1 C81.1 C82.1 C83.1 R4.2 U1.A1(VSS) U1.A17(VSS) U1.B2(VSS) U1.B6(VSS) U1.C10(VSS) U1.C13(VSS) U1.C16(VSS) U1.F1(VDDSMPS) U1.F2(VSSSMPS) U1.G2(VFBSMPS) U1.G7(VSS) U1.G8(VSS) U1.G9(VSS) U1.G10(VSS) U1.G11(VSS) U1.G16(VSS) U1.H7(VSS) U1.H8(VSS) U1.H9(VSS) U1.H10(VSS) U1.H11(VSS) U1.J3(VSS) U1.J7(VSS) U1.J8(VSS) U1.J9(VSS) U1.J10(VSS) U1.J11(VSS) U1.J16(VSS) U1.J17(VSS) U1.K7(VSS) U1.K8(VSS) U1.K9(VSS) U1.K10(VSS) U1.K11(VSS) U1.K15(VSSDSI) U1.L7(VSS) U1.L8(VSS) U1.L9(VSS) U1.L10(VSS) U1.L11(VSS) U1.L15(VSSDSI) U1.M15(VSSDSI) U1.N1(VREF-) U1.N16(VSS) U1.P1(VSSA) U1.R4(VSS) U1.R8(VSS) U1.T12(VSS) U1.U1(VSS) U1.U17(VSS) U3.A1(VSS) U3.A3(VSSQ) U3.B7(VSSQ) U3.C3(VSSQ) U3.D7(VSSQ) U3.E3(VSS) U3.J1(VSS) U8.4(GND) U8.9(PAD) Y1.1(GND) Y1.4(GND)
DSI_CK_N: U1.L17(DSI_CKN) ; port DSI.CLK_N
DSI_CK_P: U1.L16(DSI_CKP) ; port DSI.CLK_P
DSI_D0_N: U1.M17(DSI_D0N) ; port DSI.D0_N
DSI_D0_P: U1.M16(DSI_D0P) ; port DSI.D0_P
DSI_D1_N: U1.K17(DSI_D1N) ; port DSI.D1_N
DSI_D1_P: U1.K16(DSI_D1P) ; port DSI.D1_P
MEMS_32.768kHz: C72.1 R6.2 Y1.2(CLK) ; port MEMS_32.768kHz
~{NRST}: R21.2 U1.K1(NRST) ; port JTAG.~{RESET}  [project net JTAG.~{RESET}]
PA0: U1.N5(PA0) ; port ANALOG.A7  [project net MIC]
PA0_C: U1.T1(PA0_C) ; port ANALOG.A11
PA1: U1.N4(PA1) ; port CAMERA.POWER_EN
PA1_C: U1.T2(PA1_C) ; port ANALOG.A10
PA2: U1.N3(PA2) ; port PA2
PA3: U1.U2(PA3) ; port PA3
PA4: U1.U3(PA4) ; port ANALOG.DAC0
PA5: U1.T3(PA5) ; port ANALOG.DAC1  [project net LEFT]
PA6: U1.R3(PA6) ; port CAMERA.PCLK
PA7: U1.R5(PA7) ; port PA7
PA8: U1.E15(PA8) ; port UART7.RX
PA9: U1.D15(PA9) ; port USART1.TX
PA10: U1.D14(PA10) ; port BLE_CTRL.ON
PA13: U1.C15(PA13(JTMS/SWDIO)) ; port JTAG.TMS/SWD  [project net JTAG.TMS/SWD]
PA14: U1.B14(PA14(JTCK/SWCLK)) ; port JTAG.TCK/SCK  [project net JTAG.TCK/SCK]
PA15: U1.A14(PA15(JTDI)) ; port PA15
PB0: U1.U5(PB0) ; port ANALOG.A2
PB1: U1.T5(PB1) ; port ANALOG.A3
PB2: U1.R6(PB2) ; port SAI1.SD_A
PB3: U1.C6(PB3(JTDO/TRACESWO)) ; port SPI1.SCK
PB4: U1.B7(PB4(NJTRST)) ; port PB4
PB5: U1.A5(PB5) ; port FDCAN2.RX
PB6: R26.1 U1.B5(PB6) ; port I2C4.SCL, port CAMERA.SCL  [project net I2C4.SCL]
PB7: U1.C5(PB7) ; port USART1.RX
PB8: R29.1 U1.D5(PB8) ; port I2C1.SCL
PB9: R28.1 U1.D4(PB9) ; port I2C1.SDA
PB10: U1.P11(PB10) ; port WIFI_CTRL.ON
PB11: R19.1 U1.P12(PB11) ; port I2C2.SDA
PB12: U1.T14(PB12) ; port PB12
PB13: U1.U14(PB13) ; port FDCAN2.TX
PC0: U1.L2(PC0) ; port ANALOG.A6
PC1: U1.M2(PC1) ; port DFSDM1.DATIN0
PC2: U1.M3(PC2) ; port ANALOG.A5
PC2_C: U1.R1(PC2_C) ; port ANALOG.A8
PC3: U1.M4(PC3) ; port ANALOG.A4
PC3_C: U1.R2(PC3_C) ; port ANALOG.A9
PC4: U1.T4(PC4) ; port ANALOG.A0
PC5: U1.U4(PC5) ; port ANALOG.A1
PC6: U1.F14(PC6) ; port I2S2.MCK
PC7: U1.F13(PC7) ; port USART6.RX
PC8: U1.E13(PC8) ; port SDIO.D0
PC9: U1.E14(PC9) ; port SDIO.D1
PC10: U1.A13(PC10) ; port SDIO.D2
PC11: U1.B13(PC11) ; port SDIO.D3
PC12: U1.C12(PC12) ; port SDIO.CLK
PC13: R4.1 U1.E3(PC13) U1.E8(BOOT0) ; port BOOT, port PC13
PD0: U1.D13(PD0) U3.C9(DQ3)  [project net PD0_5]
PD1: U1.E12(PD1) U3.B8(DQ2)  [project net PD1_5]
PD2: U1.D12(PD2) ; port SDIO.CMD
PD3: U1.B12(PD3) ; port DFSDM1.CKOUT
PD4: U1.A12(PD4) ; port CAMERA.PWDN
PD5: U1.A11(PD5) ; port USART2.TX
PD6: U1.B11(PD6) ; port USART2.RX
PD7: U1.C11(PD7) ; port SPI1.COPI
PD8: U1.U16(PD8) U3.B2(DQ13)  [project net PD8_5]
PD9: U1.T17(PD9) U3.B1(DQ14)  [project net PD9_5]
PD10: U1.T16(PD10) U3.A2(DQ15)  [project net PD10_5]
PD11: U1.R15(PD11) U8.5(IO0(SI)) ; harness QSPI.IO0
PD12: U1.R16(PD12) U8.2(IO1(SO)) ; harness QSPI.IO1
PD13: U1.R17(PD13) ; port PD13
PD14: U1.P16(PD14) U3.A8(DQ0)  [project net PD14_5]
PD15: U1.P15(PD15) U3.B9(DQ1)  [project net PD15_5]
PE0: U1.C4(PE0) U3.E8(DQML)  [project net PE0_5]
PE1: U1.B4(PE1) U3.F1(DQMH)  [project net PE1_5]
PE2: U1.C3(PE2) U8.3(IO2~{(WP})) ; harness QSPI.IO2
PE3: U1.D3(PE3) ; port PE3
PE4: U1.D2(PE4) ; port SAI1.FS_A
PE5: U1.D1(PE5) ; port SAI1.SCK_A
PE6: U1.E5(PE6) ; port LTDC.G1
PE7: U1.U9(PE7) U3.C8(DQ4)  [project net PE7_5]
PE8: U1.T9(PE8) U3.D9(DQ5)  [project net PE8_5]
PE9: U1.P9(PE9) U3.D8(DQ6)  [project net PE9_5]
PE10: U1.N9(PE10) U3.E9(DQ7)  [project net PE10_5]
PE11: U1.P10(PE11) U3.E1(DQ8)  [project net PE11_5]
PE12: U1.R10(PE12) U3.D2(DQ9)  [project net PE12_5]
PE13: U1.T10(PE13) U3.D1(DQ10)  [project net PE13_5]
PE14: U1.U10(PE14) U3.C2(DQ11)  [project net PE14_5]
PE15: U1.R11(PE15) U3.C1(DQ12)  [project net PE15_5]
PF0: U1.G4(PF0) U3.H7(A0)  [project net PF0_5]
PF1: U1.G3(PF1) U3.H8(A1)  [project net PF1_5]
PF2: U1.G1(PF2) U3.J8(A2)  [project net PF2_5]
PF3: U1.H4(PF3) U3.J7(A3)  [project net PF3_5]
PF4: U1.J5(PF4) U3.J3(A4)  [project net PF4_5]
PF5: U1.J4(PF5) U3.J2(A5)  [project net PF5_5]
PF6: U1.K2(PF6) U8.7(IO3~{(HOLD})) ; harness QSPI.IO3
PF7: U1.K3(PF7) ; port UART7.TX
PF8: U1.K4(PF8) ; port UART7.RTS
PF9: U1.L4(PF9) ; port UART7.CTS
PF10: U1.L3(PF10) U8.6(SCK) ; harness QSPI.SCK
PF11: U1.T7(PF11) U3.F8(RAS#)  [project net PF11_5]
PF12: U1.R7(PF12) U3.H3(A6)  [project net PF12_5]
PF13: U1.P7(PF13) U3.H2(A7)  [project net PF13_5]
PF14: U1.P8(PF14) U3.H1(A8)  [project net PF14_5]
PF15: U1.R9(PF15) U3.G3(A9)  [project net PF15_5]
PG0: U1.T8(PG0) U3.H9(A10)  [project net PG0_5]
PG1: U1.U8(PG1) U3.G2(A11)  [project net PG1_5]
PG2: U1.H16(PG2) U3.G1(NC/A12)  [project net PG2_5]
PG3: U1.H15(PG3) ; port BLE_CTRL.HOST WAKE
PG4: U1.H14(PG4) U3.G7(BA0)  [project net PG4_5]
PG5: U1.G14(PG5) U3.G8(BA1)  [project net PG5_5]
PG6: U1.G15(PG6) U8.1(~{CS}) ; harness QSPI.~{CS}
PG7: U1.F16(PG7) ; port SAI1.MCLK_A
PG8: U1.F15(PG8) U3.F2(CLK)  [project net PG8_5]
PG9: U1.A10(PG9) ; port SPI1.CIPO
PG10: U1.A9(PG10) ; port LTDC.G3
PG11: U1.B9(PG11) ; port CAMERA.DOUT3
PG12: U1.C9(PG12) ; port LTDC.B1
PG13: U1.D9(PG13) ; port LTDC.R0
PG14: U1.D8(PG14) ; port USART6.TX
PG15: U1.D6(PG15) U3.F7(CAS#)  [project net PG15_5]
PH2: U1.N2(PH2) U3.F3(CKE)  [project net PH2_5]
PH3: U1.P2(PH3) U3.G9(CS#)  [project net PH3_5]
PH4: R20.1 U1.P3(PH4) ; port I2C2.SCL
PH5: U1.P4(PH5) U3.F9(WE#)  [project net PH5_5]
PH6: U1.T11(PH6) ; port SPI5.SCK
PH7: U1.U13(PH7) ; port BLE_CTRL.DEVICE WAKE
PH8: U1.T13(PH8) ; port CAMERA.HREF
PH9: U1.R13(PH9) ; port CAMERA.DOUT0
PH10: U1.P13(PH10) ; port CAMERA.DOUT1
PH11: U1.P14(PH11) ; port CAMERA.DOUT2
PH12: R27.1 U1.R14(PH12) ; port I2C4.SDA, port CAMERA.SDATA  [project net I2C4.SDA]
PH13: U1.D16(PH13) ; port USART4.TX
PH14: U1.B17(PH14) ; port CAMERA.DOUT4
PH15: U1.B16(PH15) ; port LTDC.G4
PI0: U1.A16(PI0) ; port I2S2.WS
PI1: U1.A15(PI1) ; port I2S2.CK
PI2: U1.B15(PI2) ; port I2S2.SDI
PI3: U1.C14(PI3) ; port I2S2.SDO
PI4: U1.A4(PI4) ; port CAMERA.DOUT5
PI5: U1.A3(PI5) ; port CAMERA.VSYNC
PI6: U1.A2(PI6) ; port CAMERA.DOUT6
PI7: U1.B3(PI7) ; port CAMERA.DOUT7
PI8: U1.E4(PI8) ; port WIFI_CTRL.HOST WAKE
PI9: U1.E2(PI9) ; port USART4.RX
PI10: U1.F3(PI10) ; port LTDC.HSYNC
PI11: U1.F4(PI11) ; port LTDC.G6
PI12: U1.H1(PI12) ; port PI12
PI13: U1.H2(PI13) ; port LTDC.VSYNC
PI14: U1.H3(PI14) ; port LTDC.CLK
PI15: U1.P5(PI15) ; port LTDC.G2
PJ0: U1.N6(PJ0) ; port LTDC.R1
PJ1: U1.P6(PJ1) ; port LTDC.R2
PJ2: U1.T6(PJ2) ; port LTDC.R3
PJ3: U1.U6(PJ3) ; port LTDC.R4
PJ4: U1.U7(PJ4) ; port LTDC.R5
PJ5: U1.R12(PJ5) ; port LTDC.R6
PJ6: U1.N15(PJ6) ; port LTDC.R7
PJ7: U1.N14(PJ7) ; port LTDC.G0
PJ8: U1.N13(PJ8) ; port PJ8
PJ9: U1.M14(PJ9) ; port CAMERA.XCLK
PJ10: U1.L14(PJ10) ; port SPI5.COPI
PJ11: U1.K14(PJ11) ; port SPI5.CIPO
PJ12: U1.D11(PJ12) ; port LTDC.B0
PJ13: U1.E10(PJ13) ; port PJ13
PJ14: U1.D10(PJ14) ; port LTDC.B2
PJ15: U1.B10(PJ15) ; port LTDC.B3
PK0: U1.J14(PK0) ; port LTDC.G5
PK1: U1.J15(PK1) ; port SPI5.NSS
PK2: U1.H17(PK2) ; port LTDC.G7
PK3: U1.C8(PK3) ; port LTDC.B4
PK4: U1.B8(PK4) ; port LTDC.B5
PK5: U1.A8(PK5) ; port LTDC.B6
PK6: U1.C7(PK6) ; port LTDC.B7
PK7: U1.D7(PK7) ; port LTDC.DE
USBFS_D_N: U1.E17(PA11) ; port USB_FS.D_N  [project net USB0_D_N]
USBFS_D_P: U1.E16(PA12) ; port USB_FS.D_P  [project net USB0_D_P]
USBHS_D_N: U1.U15(PB14) ; port USB_HS.D_N  [project net USB1_D_N]
USBHS_D_P: U1.T15(PB15) ; port USB_HS.D_P  [project net USB1_D_P]
VCAP_A7: C34.2 U1.A7(VCAP)  [project net VCAP_A7_5]
VCAP_D17: C33.2 U1.D17(VCAP)  [project net VCAP_D17_5]
VCAP_U11: C32.2 U1.U11(VCAP)  [project net VCAP_U11_5]
NetC35_2: C35.2 U1.N17(VCAPDSI)
NetC36_2: C36.2 L4.2 R7.2 U1.L1(VDDA)
NetC51_1: C51.1 R8.1 Y2.2
NetC52_1: C52.1 U1.J2(PH0-OSCIN) Y3.3
NetC53_1: C53.1 U1.C1(PC15-OSC32_OUT) Y2.1
NetC54_1: C54.1 U1.J1(PH1-OSCOUT) Y3.1
NetJ1_3: U1.B1(VBAT) ; port VBAT
NetJDIGITAL_3: R7.1 U1.M1(VREF+) ; port VREF_P
NetR3_2: R3.2 U1.E7(PDR_ON)
NetR5_2: R5.2 U1.G17(VDD50USB)
NetR6_1: R6.1 R8.2 U1.C2(PC14-OSC32_IN)

Not connected (* = marked no-connect by the designer): U1 E1(VLXSMPS)*; U3 E2(NC)*; Y3 2(NC)* 4(NC)*

### Layout directives
differential pair; differential pair class USB: USB0_D_N, USB0_D_P, USB1_D_N, USB1_D_P
differential pair; differential pair class DSI: DSI_CK_N, DSI_CK_P, DSI_D0_N, DSI_D0_P, DSI_D1_N, DSI_D1_P
net class RAM: PD0, PD1, PD8, PD9, PD10, PD14, PD15, PE0, PE1, PE7, PE8, PE9, PE10, PE11, PE12, PE13, PE14, PE15, PF0, PF1, PF2, PF3, PF4, PF5, PF11, PF12, PF13, PF14, PF15, PG0, PG1, PG2, PG4, PG5, PG8, PG15, PH2, PH3, PH5
net class ANALOG: PA0, PA0_C, PA1_C, PA4, PA5, PB0, PB1, PC0, PC2, PC2_C, PC3, PC3_C, PC4, PC5
net class FLASH: PD11, PD12, PE2, PF6, PF10, PG6

### Notes on the sheet
- Flash 128Mb
- (near U3) SDRAM 64Mb
- MEMS 32.768kHz
- Alternative to 32.768kHz crystal, normally DNP
- BOOT0
- RGB RED
- RGB BLUE
- RGB GREEN
- PA12
- PA11
- PB15
- PB14
- ALSO LPUART1
- COMP1_INM
- OPAMP1_VOUT
- OPAMP1_VINM
- ADC12_INP4
- ADC12_INP4, INP8
- AS PER STANDARD MOUNTING OPTION:
  VDDA CONNECTED THROUGH A FERRITE TO VDD
  VREFp CONNECTED TO VDDA
  VREFn CONNECTED TO GND
- COMP1_INP
- OPAMP1_VINP
- ADC12_INN5, INP9
- ADC12_INP5
- ADC12_INN12, INP13
- ADC123_INN11, INP12
- ADC123_INP10
- ADC3_INN1, INP0
- ADC3_INP1
- ADC12_INP1
- ADC12_INN1, INP0
- ADC1_INP16
- DAC1_OUT2
- DAC1_OUT1
- ADC12_INN18, INP19
- Title:
- ID:
- Date:
- Time:
- Version:
- Sheet
- of
- RevAuthor:
- Reference Designs ARE PROVIDED "AS IS" AND "WITH ALL FAULTS. Arduino SA DISCLAIMS ALL OTHER WARRANTIES, EXPRESS OR IMPLIED, REGARDING PRODUCTS, INCLUDING BUT NOT LIMITED TO, ANY IMPLIED WARRANTIES OF MERCHANTABILITY OR FITNESS FOR A PARTICULAR PURPOSE.
  Arduino SA may make changes to specifications and product descriptions at any time, without notice. The Customer must not rely on the absence or characteristics of any features or instructions marked "reserved" or "undefined".
  Arduino SA reserves these for future definition and shall have no responsibility whatsoever for conflicts or incompatibilities arising from future changes to them. The product information on the Web Site or Materials is subject to change without notice.
  Do not finalize a design with this info. ARDUINO and other Arduino brands and logos and Trademarks of Arduino SA. All Arduino SA Trademarks cannot be used without owner's formal permission.
- File:
- Author:

### Library data of the parts
C1 C5-C11 C16-C19 C21-C31 C57 C77-C79 C83 = C0015-A.14: as C20 on sheet POWER; Voltage: 50V; Dielectric: X5R; Part Number: GRM155R61H104KE19D; Tolerance: 10%; Case Code (Imperial): 0402; Technology: Ceramic
C12 C36 C73-C76 C80-C82 = C0091-A.13: CAP CHIP 0402 10uF 20% X5R 6.3V; Manufacturer: Murata; Code Arduino: C0091; Part Number: GRM155R60J106ME05D; Voltage: 6.3V; Dielectric: X5R; Tolerance: 20%; Case Code (Imperial): 0402; Technology: Ceramic
C13-C15 C32-C35 = C0031-A.14: as C50 on sheet POWER; Voltage: 6.3V; Part Number: GRM155R60J225KE95D; Dielectric: X5R; Case Code (Imperial): 0402; Tolerance: 10%; Technology: Ceramic
C51 C53 = C0026-A.14: CAP CHIP 0402 18pF 5% C0G 50V; Manufacturer: KEMET; Code Arduino: 2320; Part Number: C0402C180J5GACTU; Tolerance: 5%; Voltage: 50V; Dielectric: C0G; Case Code (Imperial): 0402; Technology: Ceramic
C52 C54 = C0006-A.14: CAP CHIP 0402 10pF 5% 50V C0G; Manufacturer: KEMET; Code Arduino: 3382; Part Number: C0402H100J5GACTU; Case Code (Imperial): 0402; Dielectric: C0G; Tolerance: 5%; Voltage: 50V; Technology: Ceramic
C72 = UT0021-A.3: DNP CAP 0402; Package: 0402; Part Number: DNP
L4 = I0063-A.3: IND 47uH 20% Isat 20mA f 10MHz 0603; Manufacturer: Murata; Series Resistance: 2.55; Max DC Current: 180mA; Code Arduino: I0063; Part Number: LQM18DH470M70L; Tolerance: 20%; DC Resistance (DCR): 2.55; Frequency: 10MHz; Case Code (Imperial): 0603
R3 R4 R21 = R0001-A.23: as R30 on sheet POWER; Part Number: CRCW0402100KFKEDC; Tolerance: 1%; Case Code (Imperial): 0402; Technology: Thick film
R5 = R0000-A.23: RES CHIP 0402 0R 1/16W; Manufacturer: Vishay; Code Arduino: 0039; Tolerance: 0%; Power: 62.5mW; Temperature coefficient: 0ppm; Part Number: CRCW04020000Z0EDC; Case Code (Imperial): 0402; Technology: Thick film
R6 R8 = R0000-A.23: as R22 on sheet AUDIO; Part Number: CRCW04020000Z0EDC; Case Code (Imperial): 0402; Technology: Thick film
R7 = R0017-A.23: RES CHIP 0402 330R 5% 1/16W; Manufacturer: Vishay; Code Arduino: 2229; Power: 62.5mW; Temperature coefficient: 200ppm; Part Number: CRCW0402330RJNED; Case Code (Imperial): 0402; Tolerance: 5%; Technology: Thick film
R19 R20 R26-R29 = R0210-A.18: as R36 on sheet POWER; Tolerance: 1%; Part Number: RC0402FR-075K1L; Case Code (Imperial): 0402; Technology: Thick film
U1 = U0020-A.8: IC MCU Cortex M7 + Cortex M4; Manufacturer: ST Microelectronics; Code Arduino: A5524; Part Number: STM32H747XIH6
U3 = U0122-A.4: IC SDRAM 64 Mb PC133 SDR; Manufacturer: Alliance Memory; Code Arduino: U0122; Part Number: AS4C4M16SA-6BIN
U8 = U0197-A.9: IC FLASH 128MB 6DFN 3V; Manufacturer: Adesto Technologies; Code Arduino: U0197; Part Number: AT25SF128A-MHB-T
Y1 = X0002-A.6: MEMS OSC XO 32.7680KHZ LVCMOS; Manufacturer: SiTIME; Frequency: 32.768kHz; Min Supply Voltage: 1.5V; Current Rating: 1.35uA; Load Capacitance: 10pF; Max Supply Current: 1.4uA; Code Arduino: X0002; Frequency Stability: 100ppm; Max Duty Cycle: 52%; Max Supply Voltage: 3.63V; Min Operating Temperature: -40°C; Part Number: SIT1532AI-J4-DCC-32.768E; Max Operating Temperature: 85°C
Y2 = X0003-A.5: CRYSTAL 32.768kHz 20ppm 12.5pF SMD 1.6x0.9mm; Manufacturer: Citizen FineDevice; Series Resistance: 70kR; Code Arduino: 0213; Frequency Stability: 0.12%; Max Operating Temperature: 85°C; Min Operating Temperature: -40°C; Load Capacitance: 12.5pF; Frequency: 32.768kHz; Radiation Hardening: No; Part Number: CM315D32768DZFT; Frequency Tolerance: 20ppm
Y3 = X0019-A.12: CRYSTAL 16.0000MHz 12pF SMD; Manufacturer: Fronter Electronics; Frequency: 16MHz; Code Arduino: 0395; Part Number: FTX16.000M12SM3S-30/30